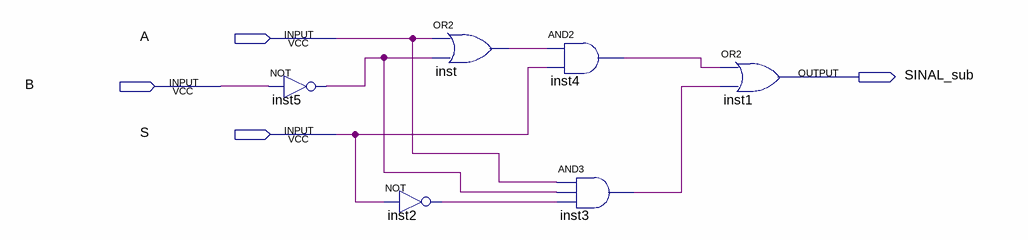
[diagram p0: schematic sheet]
// Quartus schematic SINAL_sub.bdf as structural Verilog: 6 symbols, 4 pins
module SINAL_sub (
  input  A,
  input  B,
  input  S,
  output SINAL_sub
);

  wire inst2_out, inst3_out, inst4_out, inst5_out, inst_out;

  not inst5 (inst5_out, B);
  not inst2 (inst2_out, S);
  or inst (inst_out, A, inst5_out);
  and inst4 (inst4_out, inst_out, S);
  and inst3 (inst3_out, A, inst5_out, inst2_out);
  or inst1 (SINAL_sub, inst4_out, inst3_out);
endmodule
